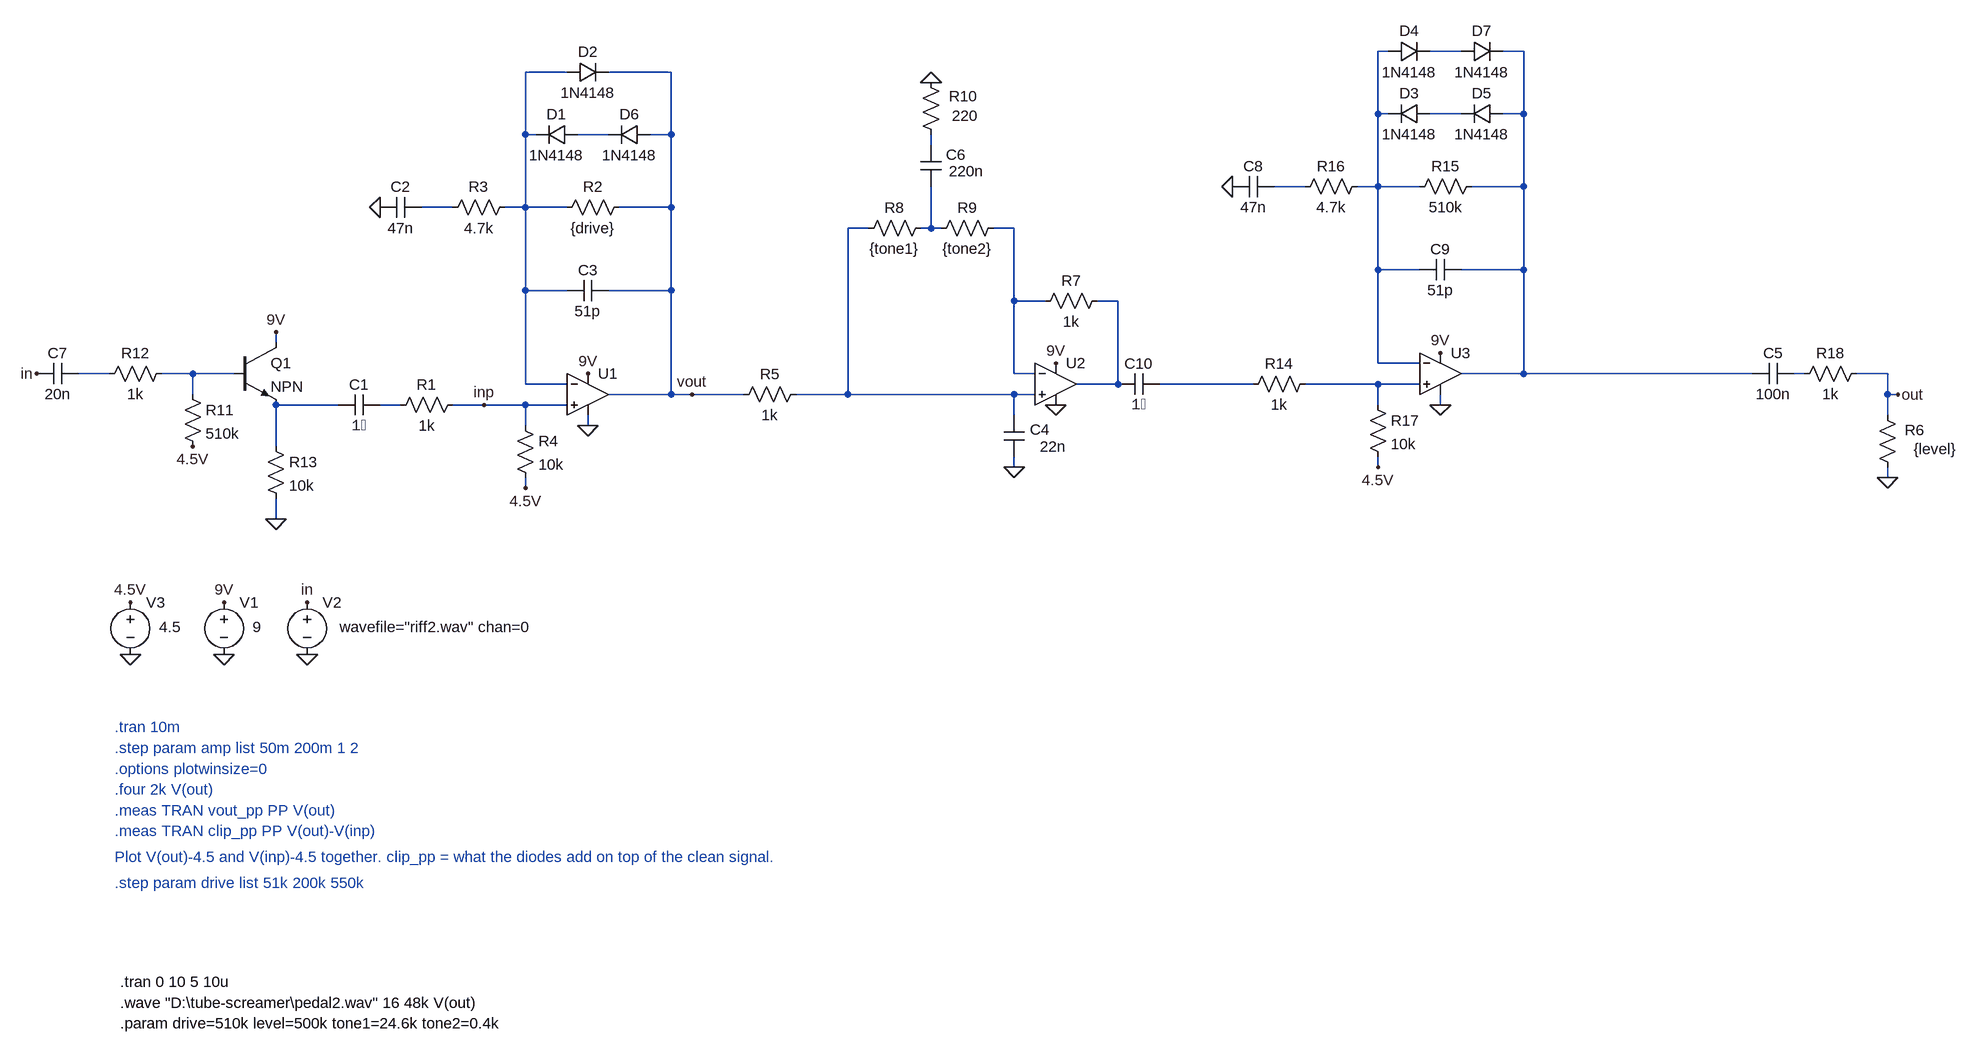
[diagram p0: schematic Clipper.asc]
Clipper.asc, the LTspice schematic file:
Version 4.1
SHEET 1 2588 1296
WIRE 1568 -384 1552 -384
WIRE 1680 -384 1632 -384
WIRE 1776 -384 1744 -384
WIRE 304 -352 240 -352
WIRE 464 -352 368 -352
WIRE 1552 -288 1552 -384
WIRE 1568 -288 1552 -288
WIRE 1680 -288 1632 -288
WIRE 1776 -288 1776 -384
WIRE 1776 -288 1744 -288
WIRE 240 -256 240 -352
WIRE 256 -256 240 -256
WIRE 368 -256 320 -256
WIRE 464 -256 464 -352
WIRE 464 -256 432 -256
WIRE 864 -240 864 -256
WIRE 1440 -176 1392 -176
WIRE 1552 -176 1552 -288
WIRE 1552 -176 1520 -176
WIRE 1616 -176 1552 -176
WIRE 1776 -176 1776 -288
WIRE 1776 -176 1696 -176
WIRE 128 -144 80 -144
WIRE 240 -144 240 -256
WIRE 240 -144 208 -144
WIRE 304 -144 240 -144
WIRE 464 -144 464 -256
WIRE 464 -144 384 -144
WIRE 768 -112 736 -112
WIRE 864 -112 864 -176
WIRE 864 -112 848 -112
WIRE 880 -112 864 -112
WIRE 992 -112 960 -112
WIRE 1552 -48 1552 -176
WIRE 1616 -48 1552 -48
WIRE 1776 -48 1776 -176
WIRE 1776 -48 1680 -48
WIRE 240 -16 240 -144
WIRE 304 -16 240 -16
WIRE 464 -16 464 -144
WIRE 464 -16 368 -16
WIRE 992 0 992 -112
WIRE 1040 0 992 0
WIRE 1152 0 1120 0
WIRE -144 64 -144 48
WIRE 1552 96 1552 -48
WIRE 1616 96 1552 96
WIRE -400 112 -448 112
WIRE -272 112 -320 112
WIRE -208 112 -272 112
WIRE 992 112 992 0
WIRE 1024 112 992 112
WIRE 1776 112 1776 -48
WIRE 1776 112 1680 112
WIRE 2128 112 1776 112
WIRE 2208 112 2192 112
WIRE 2336 112 2288 112
WIRE 240 128 240 -16
WIRE 304 128 240 128
WIRE 1152 128 1152 0
WIRE 1152 128 1088 128
WIRE 1360 128 1216 128
WIRE 1552 128 1440 128
WIRE 1616 128 1552 128
WIRE -272 144 -272 112
WIRE 464 144 464 -16
WIRE 464 144 368 144
WIRE 496 144 464 144
WIRE 576 144 496 144
WIRE 736 144 736 -112
WIRE 736 144 656 144
WIRE 992 144 736 144
WIRE 1024 144 992 144
WIRE 2336 144 2336 112
WIRE 2352 144 2336 144
WIRE -48 160 -144 160
WIRE 48 160 16 160
WIRE 176 160 128 160
WIRE 240 160 176 160
WIRE 304 160 240 160
WIRE 1552 160 1552 128
WIRE 1648 160 1648 144
WIRE 992 176 992 144
WIRE 2336 176 2336 144
WIRE 240 192 240 160
WIRE 336 192 336 176
WIRE -144 224 -144 160
WIRE 992 256 992 240
WIRE 1552 256 1552 240
WIRE 2336 272 2336 256
WIRE 240 288 240 272
WIRE -144 336 -144 304
FLAG 336 192 0
FLAG -96 544 0
FLAG 16 -144 0
FLAG -224 544 0
FLAG -224 464 9V
FLAG 336 112 9V
FLAG -368 544 0
FLAG -368 464 4.5V
FLAG 240 288 4.5V
FLAG 2336 272 0
FLAG 2352 144 out
FLAG 176 160 inp
FLAG -96 464 in
FLAG 496 144 vout
FLAG 992 256 0
FLAG 1056 160 0
FLAG 1056 96 9V
FLAG 864 -336 0
FLAG -272 224 4.5V
FLAG -512 112 in
FLAG -144 336 0
FLAG -144 48 9V
FLAG 1648 160 0
FLAG 1328 -176 0
FLAG 1648 80 9V
FLAG 1552 256 4.5V
SYMBOL voltage -224 448 R0
WINDOW 3 44 54 Left 2
WINDOW 123 0 0 Left 0
WINDOW 39 0 0 Left 0
SYMATTR Value 9
SYMATTR InstName V1
SYMBOL voltage -96 448 R0
WINDOW 123 0 0 Left 0
WINDOW 39 0 0 Left 0
WINDOW 3 50 54 Left 2
SYMATTR Value wavefile="riff2.wav" chan=0
SYMATTR InstName V2
SYMBOL cap 16 144 R90
WINDOW 0 0 32 VBottom 2
WINDOW 3 32 32 VTop 2
SYMATTR InstName C1
SYMATTR Value 1�
SYMBOL res 144 144 R90
WINDOW 0 0 56 VBottom 2
WINDOW 3 32 56 VTop 2
SYMATTR InstName R1
SYMATTR Value 1k
SYMBOL res 400 -160 R90
WINDOW 0 0 56 VBottom 2
WINDOW 3 32 56 VTop 2
SYMATTR InstName R2
SYMATTR Value {drive}
SYMBOL res 224 -160 R90
WINDOW 0 0 56 VBottom 2
WINDOW 3 32 56 VTop 2
SYMATTR InstName R3
SYMATTR Value 4.7k
SYMBOL cap 80 -160 R90
WINDOW 0 0 32 VBottom 2
WINDOW 3 32 32 VTop 2
SYMATTR InstName C2
SYMATTR Value 47n
SYMBOL voltage -368 448 R0
WINDOW 3 44 54 Left 2
WINDOW 123 0 0 Left 0
WINDOW 39 0 0 Left 0
SYMATTR Value 4.5
SYMATTR InstName V3
SYMBOL cap 368 -32 R90
WINDOW 0 0 32 VBottom 2
WINDOW 3 32 32 VTop 2
SYMATTR InstName C3
SYMATTR Value 51p
SYMBOL res 224 176 R0
SYMATTR InstName R4
SYMATTR Value 10k
SYMBOL diode 320 -272 R90
WINDOW 0 0 32 VBottom 2
WINDOW 3 32 32 VTop 2
SYMATTR InstName D1
SYMATTR Value 1N4148
SYMBOL diode 304 -336 R270
WINDOW 0 32 32 VTop 2
WINDOW 3 0 32 VBottom 2
SYMATTR InstName D2
SYMATTR Value 1N4148
SYMBOL res 672 128 R90
WINDOW 0 0 56 VBottom 2
WINDOW 3 32 56 VTop 2
SYMATTR InstName R5
SYMATTR Value 1k
SYMBOL res 2352 272 R180
WINDOW 0 -41 73 Left 2
WINDOW 3 -90 44 Left 2
SYMATTR InstName R6
SYMATTR Value {level}
SYMBOL cap 1008 240 R180
WINDOW 0 -39 42 Left 2
WINDOW 3 -64 16 Left 2
SYMATTR InstName C4
SYMATTR Value 22n
SYMBOL OpAmps\\UniversalOpAmp2 336 144 R0
SYMATTR InstName U1
SYMATTR Value2 Avol=1Meg GBW=30Meg Slew=10Meg
SYMBOL OpAmps\\UniversalOpAmp2 1056 128 R0
SYMATTR InstName U2
SYMATTR Value2 Avol=1Meg GBW=3Meg Slew=10Meg
SYMBOL res 1136 -16 R90
WINDOW 0 0 56 VBottom 2
WINDOW 3 32 56 VTop 2
SYMATTR InstName R7
SYMATTR Value 1k
SYMBOL cap 2128 128 R270
WINDOW 0 32 32 VTop 2
WINDOW 3 0 32 VBottom 2
SYMATTR InstName C5
SYMATTR Value 100n
SYMBOL res 864 -128 R90
WINDOW 0 0 56 VBottom 2
WINDOW 3 32 56 VTop 2
SYMATTR InstName R8
SYMATTR Value {tone1}
SYMBOL res 976 -128 R90
WINDOW 0 0 56 VBottom 2
WINDOW 3 32 56 VTop 2
SYMATTR InstName R9
SYMATTR Value {tone2}
SYMBOL res 880 -240 R180
WINDOW 0 -56 75 Left 2
WINDOW 3 -57 45 Left 2
SYMATTR InstName R10
SYMATTR Value 220
SYMBOL cap 880 -176 R180
WINDOW 0 -38 49 Left 2
WINDOW 3 -66 24 Left 2
SYMATTR InstName C6
SYMATTR Value 220n
SYMBOL res -288 128 R0
SYMATTR InstName R11
SYMATTR Value 510k
SYMBOL res -304 96 R90
WINDOW 0 0 56 VBottom 2
WINDOW 3 32 56 VTop 2
SYMATTR InstName R12
SYMATTR Value 1k
SYMBOL cap -448 96 R90
WINDOW 0 0 32 VBottom 2
WINDOW 3 32 32 VTop 2
SYMATTR InstName C7
SYMATTR Value 20n
SYMBOL npn -208 64 R0
SYMATTR InstName Q1
SYMBOL res -160 208 R0
SYMATTR InstName R13
SYMATTR Value 10k
SYMBOL res 1456 112 R90
WINDOW 0 0 56 VBottom 2
WINDOW 3 32 56 VTop 2
SYMATTR InstName R14
SYMATTR Value 1k
SYMBOL res 1712 -192 R90
WINDOW 0 0 56 VBottom 2
WINDOW 3 32 56 VTop 2
SYMATTR InstName R15
SYMATTR Value 510k
SYMBOL res 1536 -192 R90
WINDOW 0 0 56 VBottom 2
WINDOW 3 32 56 VTop 2
SYMATTR InstName R16
SYMATTR Value 4.7k
SYMBOL cap 1392 -192 R90
WINDOW 0 0 32 VBottom 2
WINDOW 3 32 32 VTop 2
SYMATTR InstName C8
SYMATTR Value 47n
SYMBOL cap 1680 -64 R90
WINDOW 0 0 32 VBottom 2
WINDOW 3 32 32 VTop 2
SYMATTR InstName C9
SYMATTR Value 51p
SYMBOL res 1536 144 R0
SYMATTR InstName R17
SYMATTR Value 10k
SYMBOL diode 1632 -304 R90
WINDOW 0 0 32 VBottom 2
WINDOW 3 32 32 VTop 2
SYMATTR InstName D3
SYMATTR Value 1N4148
SYMBOL diode 1568 -368 R270
WINDOW 0 32 32 VTop 2
WINDOW 3 0 32 VBottom 2
SYMATTR InstName D4
SYMATTR Value 1N4148
SYMBOL OpAmps\\UniversalOpAmp2 1648 112 R0
SYMATTR InstName U3
SYMATTR Value2 Avol=1Meg GBW=30Meg Slew=10Meg
SYMBOL res 2304 96 R90
WINDOW 0 0 56 VBottom 2
WINDOW 3 32 56 VTop 2
SYMATTR InstName R18
SYMATTR Value 1k
SYMBOL cap 1216 112 R90
WINDOW 0 0 32 VBottom 2
WINDOW 3 32 32 VTop 2
SYMATTR InstName C10
SYMATTR Value 1�
SYMBOL diode 1744 -304 R90
WINDOW 0 0 32 VBottom 2
WINDOW 3 32 32 VTop 2
SYMATTR InstName D5
SYMATTR Value 1N4148
SYMBOL diode 432 -272 R90
WINDOW 0 0 32 VBottom 2
WINDOW 3 32 32 VTop 2
SYMATTR InstName D6
SYMATTR Value 1N4148
SYMBOL diode 1680 -368 R270
WINDOW 0 32 32 VTop 2
WINDOW 3 0 32 VBottom 2
SYMATTR InstName D7
SYMATTR Value 1N4148
TEXT -392 656 Left 2 ;.tran 10m
TEXT -392 688 Left 2 ;.step param amp list 50m 200m 1 2
TEXT -392 720 Left 2 ;.options plotwinsize=0
TEXT -392 752 Left 2 ;.four 2k V(out)
TEXT -392 784 Left 2 ;.meas TRAN vout_pp PP V(out)
TEXT -392 816 Left 2 ;.meas TRAN clip_pp PP V(out)-V(inp)
TEXT -392 856 Left 2 ;Plot V(out)-4.5 and V(inp)-4.5 together. clip_pp = what the diodes add on top of the clean signal.
TEXT -392 896 Left 2 ;.step param drive list 51k 200k 550k
TEXT -384 1048 Left 2 !.tran 0 10 5 10u
TEXT -384 1080 Left 2 !.wave "D:\\tube-screamer\\pedal2.wav" 16 48k V(out)
TEXT -384 1112 Left 2 !.param drive=510k level=500k tone1=24.6k tone2=0.4k

The netlist it stands for:
* Clipper.asc
V1 9V 0 9
V2 in 0 wavefile="riff2.wav" chan=0
C1 N020 N019 1�
R1 inp N020 1k
R2 vout N004 {drive}
R3 N004 N009 4.7k
C2 N009 0 47n
V3 4.5V 0 4.5
C3 vout N004 51p
R4 inp 4.5V 10k
D1 N006 N004 1N4148
D2 N004 vout 1N4148
R5 N010 vout 1k
R6 0 out {level}
C4 0 N010 22n
X§U1 inp N004 9V 0 vout level2 Avol=1Meg GBW=30Meg Slew=10Meg Ilimit=25m Rail=0 Vos=0 En=0 Enk=0 In=0 Ink=0 Rin=500Meg  ; pins In+ In- V+ V- OUT
X§U2 N010 N012 9V 0 N013 level2 Avol=1Meg GBW=3Meg Slew=10Meg Ilimit=25m Rail=0 Vos=0 En=0 Enk=0 In=0 Ink=0 Rin=500Meg  ; pins In+ In- V+ V- OUT
R7 N013 N012 1k
C5 N003 N016 100n
R8 N011 N010 {tone1}
R9 N012 N011 {tone2}
R10 N007 0 220
C6 N011 N007 220n
R11 N015 4.5V 510k
R12 N015 N014 1k
C7 N014 in 20n
Q1 9V N015 N019 0 NPN
R13 N019 0 10k
R14 N018 N017 1k
R15 N003 N001 510k
R16 N001 N008 4.7k
C8 N008 0 47n
C9 N003 N001 51p
R17 N018 4.5V 10k
D3 N005 N001 1N4148
D4 N001 N002 1N4148
X§U3 N018 N001 9V 0 N003 level2 Avol=1Meg GBW=30Meg Slew=10Meg Ilimit=25m Rail=0 Vos=0 En=0 Enk=0 In=0 Ink=0 Rin=500Meg  ; pins In+ In- V+ V- OUT
R18 out N016 1k
C10 N017 N013 1�
D5 N003 N005 1N4148
D6 vout N006 1N4148
D7 N002 N003 1N4148
.model D D
.lib standard.dio
.model NPN NPN
.model PNP PNP
.lib standard.bjt
* .tran 10m
* .step param amp list 50m 200m 1 2
* .options plotwinsize=0
* .four 2k V(out)
* .meas TRAN vout_pp PP V(out)
* .meas TRAN clip_pp PP V(out)-V(inp)
* Plot V(out)-4.5 and V(inp)-4.5 together. clip_pp = what the diodes add on top of the clean signal.
* .step param drive list 51k 200k 550k
.tran 0 10 5 10u
.wave "D:\tube-screamer\pedal2.wav" 16 48k V(out)
.param drive=510k level=500k tone1=24.6k tone2=0.4k
.lib UniversalOpAmp2.lib
.backanno
.end